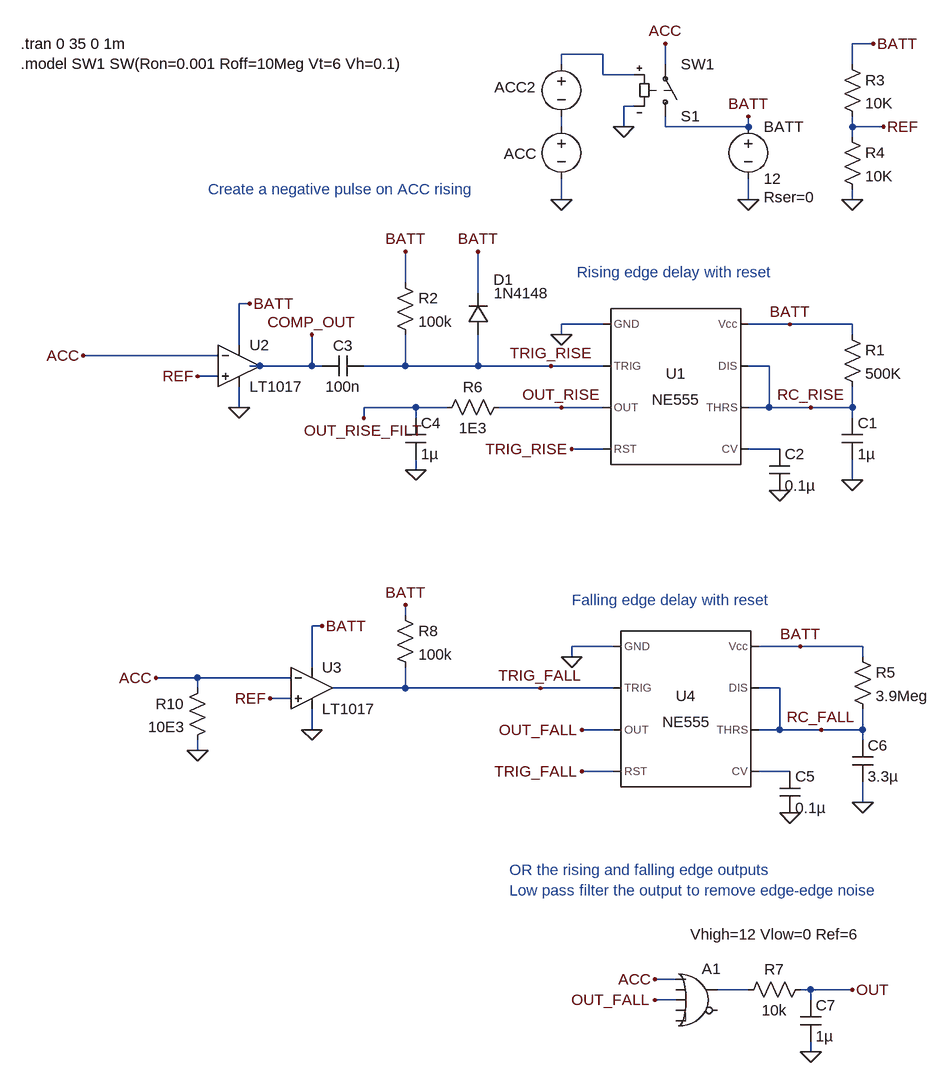
[diagram p0: schematic 555_monostable.asc]
555_monostable.asc, the LTspice schematic file:
Version 4.1
SHEET 1 880 1296
WIRE 400 -464 368 -464
WIRE -16 -448 -80 -448
WIRE -80 -432 -80 -448
WIRE 80 -432 80 -464
WIRE 368 -432 368 -464
WIRE -16 -416 -16 -448
WIRE 32 -416 -16 -416
WIRE 32 -368 16 -368
WIRE -80 -336 -80 -352
WIRE 16 -336 16 -368
WIRE 80 -336 80 -352
WIRE 208 -336 208 -352
WIRE 208 -336 80 -336
WIRE 368 -336 368 -352
WIRE 416 -336 368 -336
WIRE 368 -320 368 -336
WIRE -80 -224 -80 -256
WIRE 208 -224 208 -256
WIRE 368 -224 368 -240
WIRE -320 -96 -320 -144
WIRE -208 -80 -208 -144
WIRE -560 -64 -576 -64
WIRE -16 -32 -80 -32
WIRE 272 -32 208 -32
WIRE 368 -32 272 -32
WIRE -80 -16 -80 -32
WIRE 368 -16 368 -32
WIRE -576 0 -576 -64
WIRE -608 16 -816 16
WIRE -544 32 -560 32
WIRE -464 32 -464 -16
WIRE -464 32 -544 32
WIRE -448 32 -464 32
WIRE -320 32 -320 -16
WIRE -320 32 -384 32
WIRE -208 32 -208 -16
WIRE -208 32 -320 32
WIRE -96 32 -208 32
WIRE -16 32 -96 32
WIRE 240 32 208 32
WIRE -608 48 -640 48
WIRE -576 96 -576 64
WIRE -304 96 -384 96
WIRE -256 96 -304 96
WIRE -80 96 -176 96
WIRE -16 96 -80 96
WIRE 240 96 240 32
WIRE 240 96 208 96
WIRE 304 96 240 96
WIRE 368 96 368 64
WIRE 368 96 304 96
WIRE -384 112 -384 96
WIRE -304 112 -304 96
WIRE 368 112 368 96
WIRE -16 160 -64 160
WIRE 256 160 208 160
WIRE -304 192 -304 176
WIRE 368 208 368 176
WIRE -320 416 -320 400
WIRE -448 432 -464 432
WIRE 0 464 -64 464
WIRE 288 464 224 464
WIRE 384 464 288 464
WIRE -64 480 -64 464
WIRE 384 480 384 464
WIRE -464 496 -464 432
WIRE -640 512 -704 512
WIRE -496 512 -640 512
WIRE -640 528 -640 512
WIRE -320 528 -320 496
WIRE -320 528 -432 528
WIRE -112 528 -320 528
WIRE 0 528 -112 528
WIRE 256 528 224 528
WIRE -496 544 -528 544
WIRE -464 592 -464 560
WIRE 0 592 -48 592
WIRE 256 592 256 528
WIRE 256 592 224 592
WIRE 320 592 256 592
WIRE 384 592 384 560
WIRE 384 592 320 592
WIRE 384 608 384 592
WIRE -640 624 -640 608
WIRE 0 656 -48 656
WIRE 272 656 224 656
WIRE 384 704 384 672
WIRE 96 976 64 976
WIRE 208 992 160 992
WIRE 304 992 288 992
WIRE 368 992 304 992
WIRE 96 1008 64 1008
WIRE 304 1008 304 992
WIRE 304 1088 304 1072
FLAG 256 224 0
FLAG -80 96 OUT_RISE
FLAG -96 32 TRIG_RISE
FLAG 368 208 0
FLAG 208 -224 0
FLAG -80 -16 0
FLAG 272 -32 BATT
FLAG -64 160 TRIG_RISE
FLAG 208 -352 BATT
FLAG -80 -224 0
FLAG 80 -464 ACC
FLAG 368 -224 0
FLAG 400 -464 BATT
FLAG 416 -336 REF
FLAG -560 -64 BATT
FLAG -576 96 0
FLAG -640 48 REF
FLAG -816 16 ACC
FLAG -464 -16 COMP_OUT
FLAG -320 -144 BATT
FLAG -208 -144 BATT
FLAG 304 96 RC_RISE
FLAG -304 192 0
FLAG 368 992 OUT
FLAG 272 720 0
FLAG -48 592 OUT_FALL
FLAG 384 704 0
FLAG -64 480 0
FLAG 288 464 BATT
FLAG -48 656 TRIG_FALL
FLAG 320 592 RC_FALL
FLAG 304 1088 0
FLAG -320 400 BATT
FLAG -112 528 TRIG_FALL
FLAG 64 1008 OUT_FALL
FLAG 64 976 ACC
FLAG -384 112 OUT_RISE_FILT
FLAG 16 -336 0
FLAG -448 432 BATT
FLAG -464 592 0
FLAG -528 544 REF
FLAG -704 512 ACC
FLAG -640 624 0
SYMBOL Misc\\NE555 96 64 R0
SYMATTR InstName U1
SYMBOL voltage 208 -352 R0
WINDOW 123 0 0 Left 0
WINDOW 39 24 124 Left 2
SYMATTR SpiceLine Rser=0
SYMATTR InstName BATT
SYMATTR Value 12
SYMBOL voltage -80 -352 R0
WINDOW 3 -339 49 Invisible 2
WINDOW 0 -88 57 Left 2
SYMATTR Value PULSE(0 12 0.2 1m 1m 0.1 0.2 2)
SYMATTR InstName ACC
SYMBOL cap 240 160 R0
SYMATTR InstName C2
SYMATTR Value 0.1µ
SYMBOL res 352 -32 R0
SYMATTR InstName R1
SYMATTR Value 500K
SYMBOL cap 352 112 R0
SYMATTR InstName C1
SYMATTR Value 1µ
SYMBOL res -336 -112 R0
SYMATTR InstName R2
SYMATTR Value 100k
SYMBOL diode -192 -16 R180
WINDOW 0 -38 85 Left 2
WINDOW 3 -93 64 Left 2
SYMATTR InstName D1
SYMATTR Value 1N4148
SYMBOL Comparators\\LT1017 -576 32 R0
SYMATTR InstName U2
SYMBOL res 352 -448 R0
SYMATTR InstName R3
SYMATTR Value 10K
SYMATTR SpiceLine tol=10K
SYMBOL res 352 -336 R0
SYMATTR InstName R4
SYMATTR Value 10K
SYMBOL cap -384 16 R90
WINDOW 0 0 32 VBottom 2
WINDOW 3 32 32 VTop 2
SYMATTR InstName C3
SYMATTR Value 100n
SYMBOL res -272 112 R270
WINDOW 0 32 56 VTop 2
WINDOW 3 0 56 VBottom 2
SYMATTR InstName R6
SYMATTR Value 1E3
SYMBOL cap -320 112 R0
SYMATTR InstName C4
SYMATTR Value 1µ
SYMBOL Digital\\or 128 944 R0
WINDOW 39 -9 -37 Left 2
SYMATTR SpiceLine Vhigh=12 Vlow=0 Ref=6
SYMATTR InstName A1
SYMBOL voltage -80 -448 R0
WINDOW 3 24 96 Invisible 2
WINDOW 123 0 0 Left 0
WINDOW 39 0 0 Left 0
WINDOW 0 -103 51 Left 2
SYMATTR Value PULSE(0 12 0.8 1m 1m 0.8 1 1)
SYMATTR InstName ACC2
SYMBOL Misc\\NE555 112 560 R0
SYMATTR InstName U4
SYMBOL cap 256 656 R0
SYMATTR InstName C5
SYMATTR Value 0.1µ
SYMBOL res 368 464 R0
SYMATTR InstName R5
SYMATTR Value 3.9Meg
SYMBOL cap 368 608 R0
SYMATTR InstName C6
SYMATTR Value 3.3µ
SYMBOL res 304 976 R90
WINDOW 0 0 56 VBottom 2
WINDOW 3 32 56 VTop 2
SYMATTR InstName R7
SYMATTR Value 10k
SYMBOL cap 288 1008 R0
SYMATTR InstName C7
SYMATTR Value 1µ
SYMBOL res -336 400 R0
SYMATTR InstName R8
SYMATTR Value 100k
SYMBOL sw 80 -336 M180
SYMATTR InstName S1
SYMATTR Value SW1
SYMBOL Comparators\\LT1017 -464 528 R0
SYMATTR InstName U3
SYMBOL res -624 512 M0
SYMATTR InstName R10
SYMATTR Value 10E3
TEXT -912 -464 Left 2 !.tran 0 35 0 1m\n.model SW1 SW(Ron=0.001 Roff=10Meg Vt=6 Vh=0.1)
TEXT -64 392 Left 2 ;Falling edge delay with reset
TEXT -56 -112 Left 2 ;Rising edge delay with reset
TEXT -160 808 Left 2 ;OR the rising and falling edge outputs\nLow pass filter the output to remove edge-edge noise
TEXT -624 -240 Left 2 ;Create a negative pulse on ACC rising

The netlist it stands for:
* 555_monostable.asc
X§U1 0 TRIG_RISE OUT_RISE TRIG_RISE N003 RC_RISE RC_RISE BATT NE555  ; pins GND TRIG OUT RST CV THRS DIS Vcc
V§BATT BATT 0 12 Rser=0
V§ACC N002 0 PULSE(0 12 0.2 1m 1m 0.1 0.2 2)
C2 N003 0 0.1µ
R1 BATT RC_RISE 500K
C1 RC_RISE 0 1µ
R2 BATT TRIG_RISE 100k
D1 TRIG_RISE BATT 1N4148
X§U2 REF ACC BATT 0 COMP_OUT LT1017  ; pins In+ In- V+ V- OUT
R3 BATT REF 10K tol=10K
R4 REF 0 10K
C3 TRIG_RISE COMP_OUT 100n
R6 OUT_RISE_FILT OUT_RISE 1E3
C4 OUT_RISE_FILT 0 1µ
A1 ACC 0 OUT_FALL 0 0 0 N005 0 OR Vhigh=12 Vlow=0 Ref=6
V§ACC2 N001 N002 PULSE(0 12 0.8 1m 1m 0.8 1 1)
X§U4 0 TRIG_FALL OUT_FALL TRIG_FALL N004 RC_FALL RC_FALL BATT NE555  ; pins GND TRIG OUT RST CV THRS DIS Vcc
C5 N004 0 0.1µ
R5 BATT RC_FALL 3.9Meg
C6 RC_FALL 0 3.3µ
R7 OUT N005 10k
C7 OUT 0 1µ
R8 BATT TRIG_FALL 100k
S1 BATT ACC N001 0 SW1
X§U3 REF ACC BATT 0 TRIG_FALL LT1017  ; pins In+ In- V+ V- OUT
R10 ACC 0 10E3
.model D D
.lib standard.dio
.tran 0 35 0 1m
.model SW1 SW(Ron=0.001 Roff=10Meg Vt=6 Vh=0.1)
* Falling edge delay with reset
* Rising edge delay with reset
* OR the rising and falling edge outputs
* Low pass filter the output to remove edge-edge noise
* Create a negative pulse on ACC rising
.lib NE555.sub
.backanno
.end